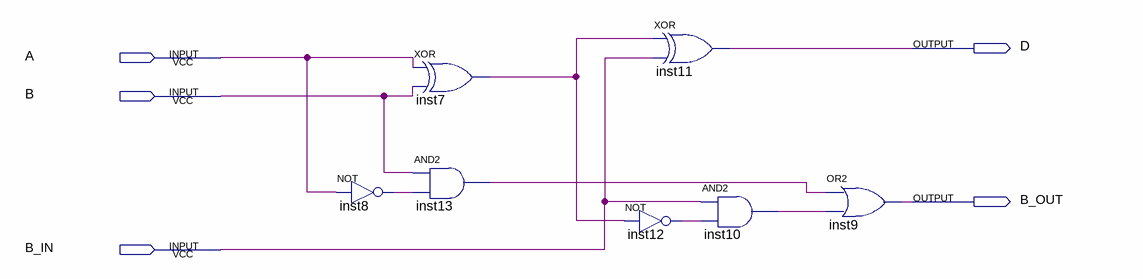
[diagram p0: schematic sheet]
// Quartus schematic aula_07.bdf as structural Verilog: 7 symbols, 5 pins
module aula_07 (
  input  A,
  input  B,
  input  B_IN,
  output D,
  output B_OUT
);

  wire inst7_out, inst8_out, inst10_out, inst12_out, inst13_out;

  not inst8 (inst8_out, A);
  xor inst7 (inst7_out, A, B);
  and inst13 (inst13_out, B, inst8_out);
  xor inst11 (D, inst7_out, B_IN);
  not inst12 (inst12_out, inst7_out);
  and inst10 (inst10_out, B_IN, inst12_out);
  or inst9 (B_OUT, inst13_out, inst10_out);
endmodule
